# Altium schematic sheet Radar_Power_Sheet.SchDoc
size 420 x 297 mm; SheetNumber: 3; SheetTotal: 6
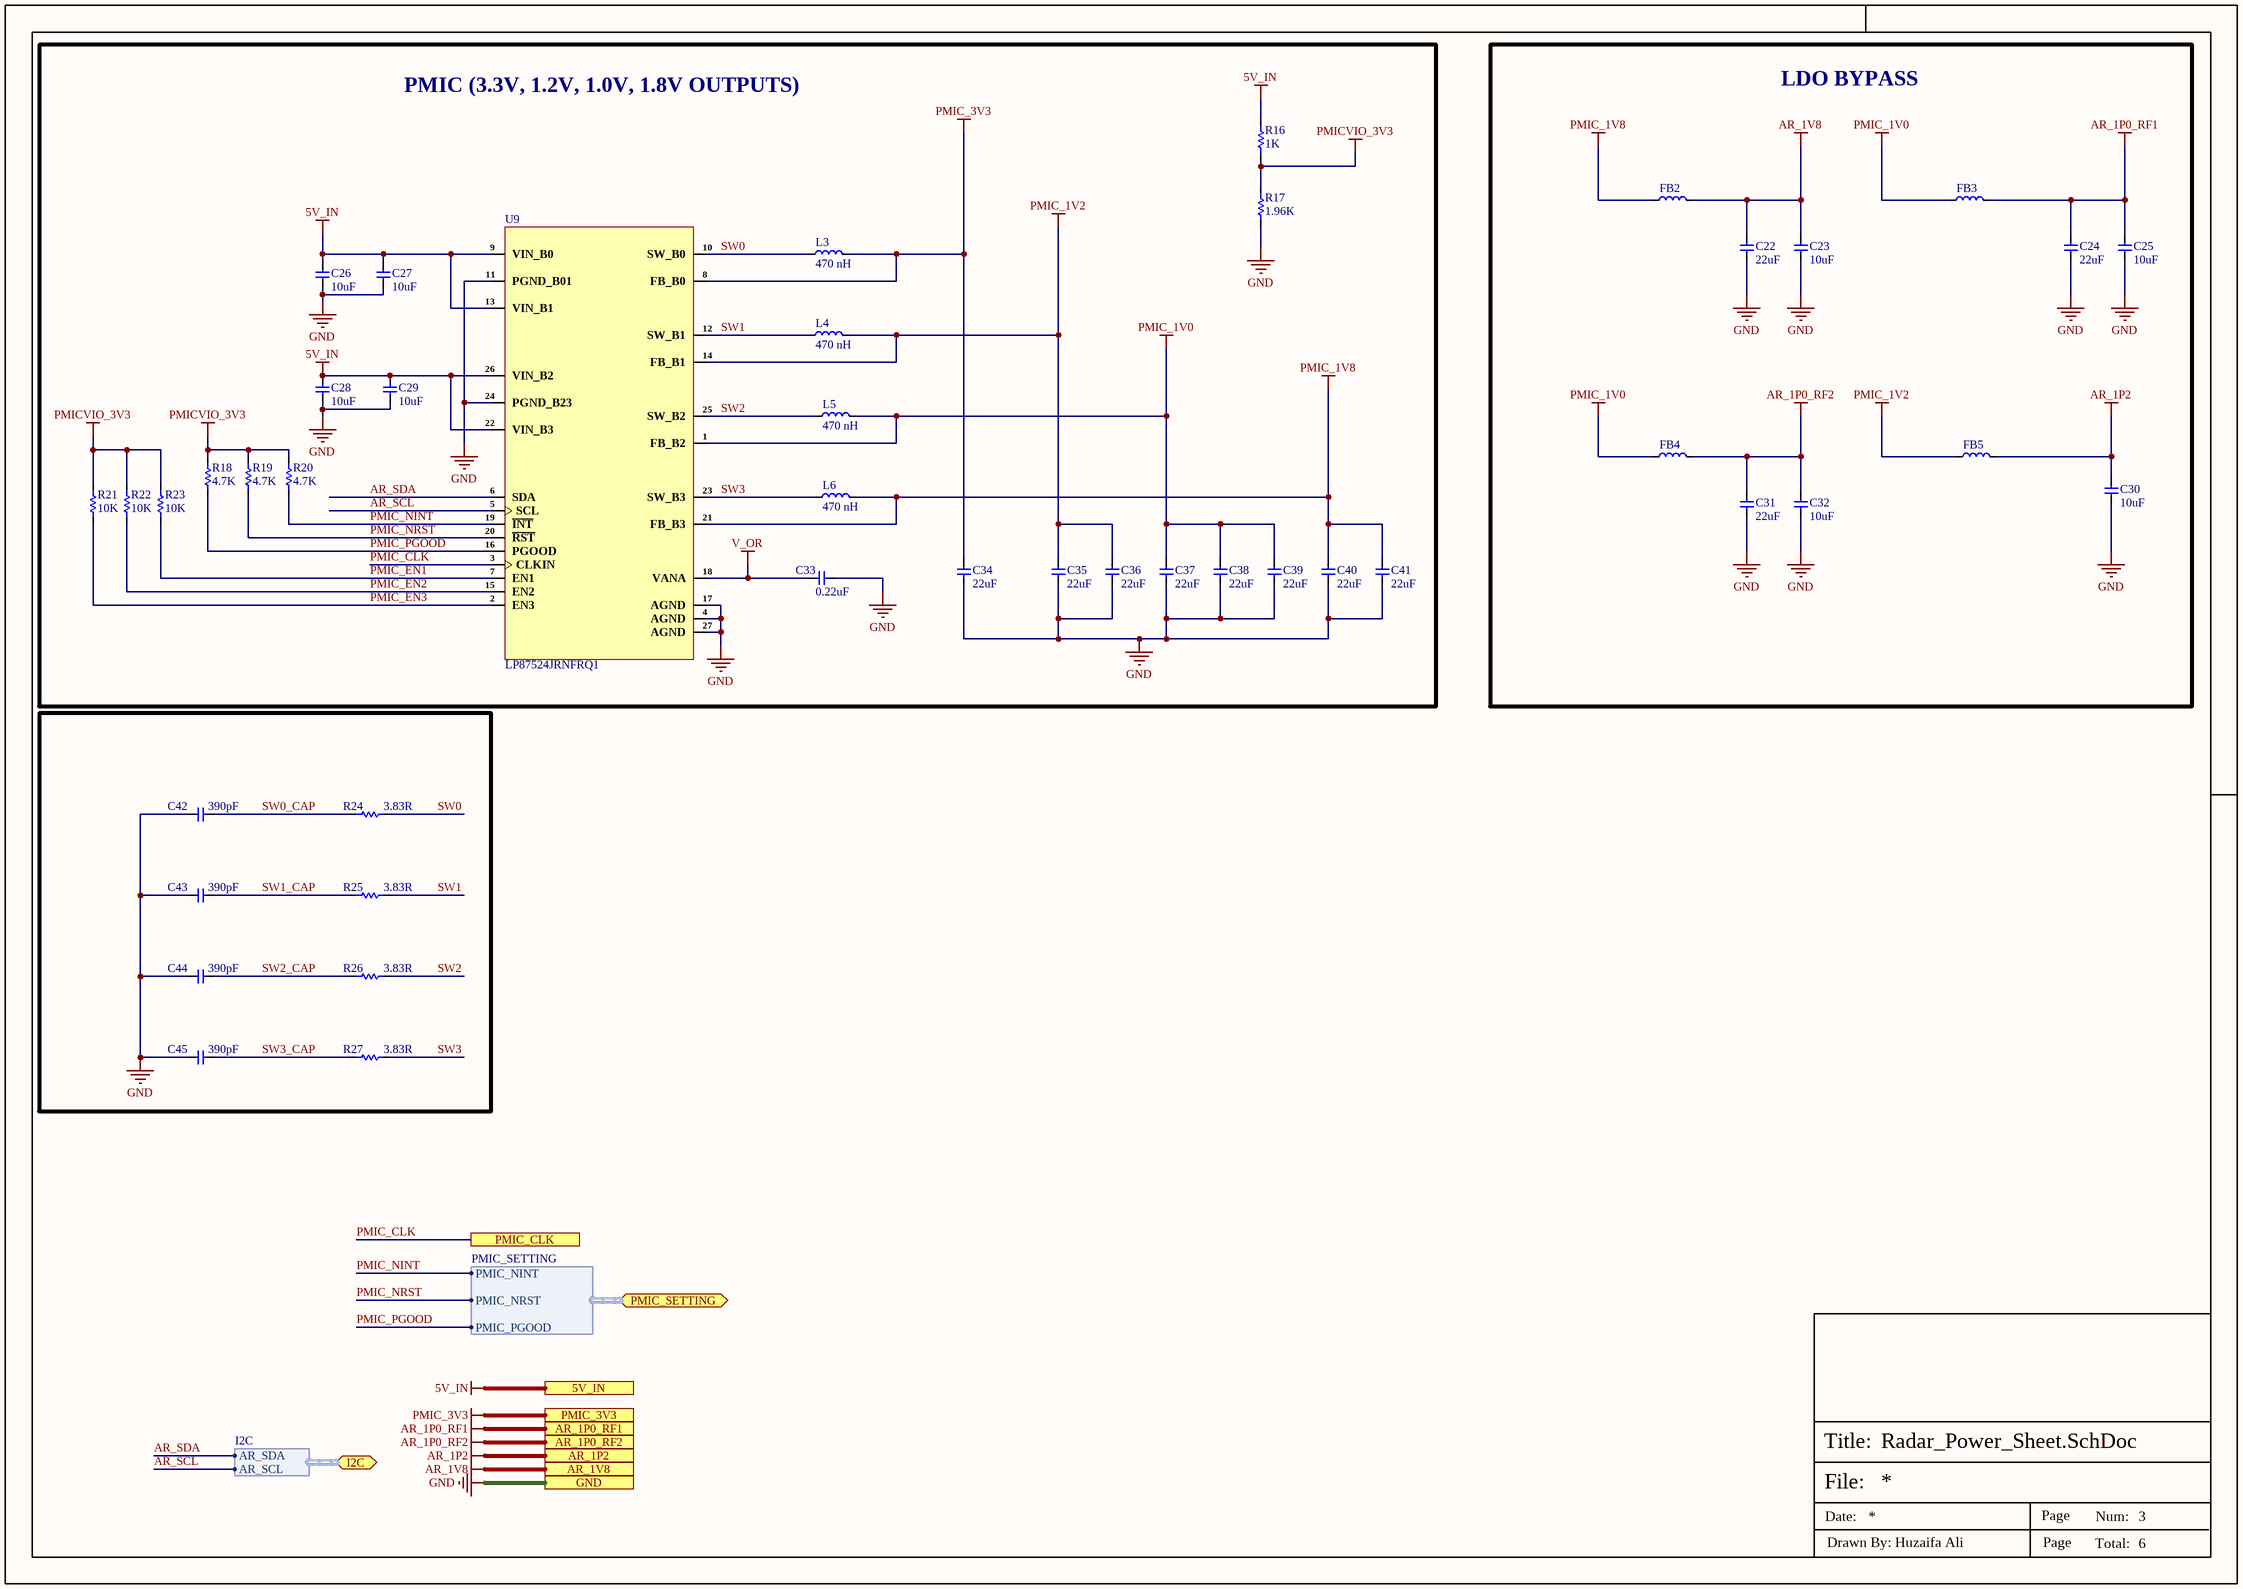
[diagram p0: Radar_Power_Sheet.SchDoc]

## Parts
C22  22uF  [Cap-1206]
C23  10uF  [Cap-0603]
C24  22uF  [Cap-1206]
C25  10uF  [Cap-0603]
C26  10uF  [Cap-0603]
C27  10uF  [Cap-0603]
C28  10uF  [Cap-0603]
C29  10uF  [Cap-0603]
C30  10uF  [Cap-0603]
C31  22uF  [Cap-1206]
C32  10uF  [Cap-0603]
C33  0.22uF  [Cap-0402]
C34  22uF  [Cap-1206]
C35  22uF  [Cap-1206]
C36  22uF  [Cap-1206]
C37  22uF  [Cap-1206]
C38  22uF  [Cap-1206]
C39  22uF  [Cap-1206]
C40  22uF  [Cap-1206]
C41  22uF  [Cap-1206]
C42  390pF  [Cap-0402]
C43  390pF  [Cap-0402]
C44  390pF  [Cap-0402]
C45  390pF  [Cap-0402]
FB2  100MHz  [IND-0603 (1608 Metric)]  (value not drawn)
FB3  100MHz  [IND-0603 (1608 Metric)]  (value not drawn)
FB4  100MHz  [IND-0603 (1608 Metric)]  (value not drawn)
FB5  100MHz  [IND-0603 (1608 Metric)]  (value not drawn)
L3  470 nH  [IND-1008 (2520 Metric)]
L4  470 nH  [IND-1008 (2520 Metric)]
L5  470 nH  [IND-1008 (2520 Metric)]
L6  470 nH  [IND-1008 (2520 Metric)]
R16  1K  [Res-0201]
R17  1.96K  [Res-0603]
R18  4.7K  [Res-0402]
R19  4.7K  [Res-0402]
R20  4.7K  [Res-0402]
R21  10K  [Res-0402]
R22  10K  [Res-0402]
R23  10K  [Res-0402]
R24  3.83R  [Res-0402]
R25  3.83R  [Res-0402]
R26  3.83R  [Res-0402]
R27  3.83R  [Res-0402]
U9  LP87524JRNFRQ1  [26-VQFN-HR (4.5x4)]

## Blocks framed on the sheet
PMIC (3.3V, 1.2V, 1.0V, 1.8V OUTPUTS): C26-C29 C33-C41 L3-L6 R16-R23 U9
LDO BYPASS: C22-C25 C30-C32 FB2-FB5

## Ports
5V_IN, AR_1P0_RF1, AR_1P0_RF2, AR_1P2, AR_1V8, GND, I2C (bidir, harness I2C), PMIC_3V3, PMIC_CLK, PMIC_SETTING (bidir, harness PMIC_SETTING)

## Harnesses
I2C: AR_SDA, AR_SCL
PMIC_SETTING: PMIC_NINT, PMIC_NRST, PMIC_PGOOD

## Nets
5V_IN: C26.2 C27.2 C28.2 C29.2 R16.1 U9.9(VIN_B0) U9.13(VIN_B1) U9.22(VIN_B3) U9.26(VIN_B2) ; port 5V_IN
AR_1P0_RF1: C24.2 C25.2 FB3.2 ; port AR_1P0_RF1
AR_1P0_RF2: C31.2 C32.2 FB4.2 ; port AR_1P0_RF2
AR_1P2: C30.2 FB5.2 ; port AR_1P2
AR_1V8: C22.2 C23.2 FB2.2 ; port AR_1V8
GND: C22.1 C23.1 C24.1 C25.1 C26.1 C27.1 C28.1 C29.1 C30.1 C31.1 C32.1 C33.2 C34.1 C35.1 C36.1 C37.1 C38.1 C39.1 C40.1 C41.1 C42.1 C43.1 C44.1 C45.1 R17.1 U9.4(AGND) U9.11(PGND_B01) U9.17(AGND) U9.24(PGND_B23) U9.27(AGND) ; port GND
PMIC_1V0: C37.2 C38.2 C39.2 FB3.1 FB4.1 L5.2 U9.1(FB_B2)
PMIC_1V2: C35.2 C36.2 FB5.1 L4.2 U9.14(FB_B1)
PMIC_1V8: C40.2 C41.2 FB2.1 L6.2 U9.21(FB_B3)
PMIC_3V3: C34.2 L3.2 U9.8(FB_B0) ; port PMIC_3V3
PMICVIO_3V3: R16.2 R17.2 R18.2 R19.2 R20.2 R21.2 R22.2 R23.2
V_OR: C33.1 U9.18(VANA)
AR_SCL: U9.5(SCL) ; port I2C.AR_SCL
AR_SDA: U9.6(SDA) ; port I2C.AR_SDA
PMIC_CLK: U9.3(CLKIN) ; port PMIC_CLK
PMIC_EN1: R23.1 U9.7(EN1)
PMIC_EN2: R22.1 U9.15(EN2)
PMIC_EN3: R21.1 U9.2(EN3)
PMIC_NINT: R20.1 U9.19(~{INT}) ; port PMIC_SETTING.PMIC_NINT
PMIC_NRST: R19.1 U9.20(~{RST}) ; port PMIC_SETTING.PMIC_NRST
PMIC_PGOOD: R18.1 U9.16(PGOOD) ; port PMIC_SETTING.PMIC_PGOOD
SW0: L3.1 R24.2 U9.10(SW_B0)
SW0_CAP: C42.2 R24.1
SW1: L4.1 R25.2 U9.12(SW_B1)
SW1_CAP: C43.2 R25.1
SW2: L5.1 R26.2 U9.25(SW_B2)
SW2_CAP: C44.2 R26.1
SW3: L6.1 R27.2 U9.23(SW_B3)
SW3_CAP: C45.2 R27.1

## Notes on the sheet
- File:
- Title:
- Date:
- Page
- Num:
- Total:
- Drawn By: Huzaifa Ali

## Library data of the parts
C22 C24 C31 C34-C41 = C3216X5R1E226M160AB: CAP CER 22UF 25V X5R 1206; Manufacturer: TDK; Dielectric Material: Ceramic; Tolerance: 20%; Item Type: Capacitor; Supplier 1: Digi-Key; Manufacturer Part Number: C3216X5R1E226M160AB; Stock 1: 21442; Pricing 1: 1=1.08, 10=0.822, 50=0.6832, 100=0.5882, 500=0.4554, 1000=0.39215 (USD); Mount: Surface Mount; Case/Package: 1206; Case Code (Metric): 3216; Case Code (Imperial): 1206; Weight: 0.000571oz; Min Operating Temperature: -55°C; Max Operating Temperature: 85°C; Voltage Rating: 25V; Capacitance: 22uF; Packaging: Tape and Reel; Voltage Rating (DC): 25V; Dielectric: X5R; Termination: SMD/SMT; Construction: Flat; Package Quantity: 1; Resistor Type: Ceramic; Series: C; Length: 3.2mm; Width: 0.063inch; Height: 1.6mm; Depth: 1.6mm; Thickness: 0.071inch; Lead Free: Lead Free; REACH SVHC: No SVHC; RoHS Compliant: Yes; ComponentLink1URL: https://product.tdk.com/info/en/documents/chara_sheet/C3216X5R1E226M160AB.pdf?src-supplier=Digi-Key; ComponentLink1Description: https://product.tdk.com/info/en/documents/chara_sheet/C3216X5R1E226M160AB.pdf?src-supplier=Digi-Key; ComponentLink2URL: http://www.mouser.com/ds/2/400/lcc_commercial_general_en-837201.pdf?src-supplier=Mouser; ComponentLink2Description: http://www.mouser.com/ds/2/400/lcc_commercial_general_en-837201.pdf?src-supplier=Mouser; Supplier Part Number 1: 445-6000-1-ND; LCSC Part Number: C2167811
C23 C25-C30 C32 = CC0603KRX5R7BB106: CAP CER 10UF 16V X5R 0603; Manufacturer: Yageo; Tolerance: 10%; Item Type: Capacitor; Supplier 1: Digi-Key; Manufacturer Part Number: CC0603KRX5R7BB106; RoHS: Yes; Category: Ceramic Capacitors; Stock 1: 240725; Pricing 1: 1=0.68000, 10=0.48000, 50=0.36300, 100=0.31610, 500=0.23416, 1000=0.19903 (USD); Mount: Surface Mount; Case/Package: 0603; Case Code (Imperial): 0603; Case Code (Metric): 1608; Min Operating Temperature: -55°C; Max Operating Temperature: 85°C; Packaging: Cut Tape; Capacitance: 10uF; Voltage Rating: 16V; RoHS Compliant: Yes; ComponentLink1URL: http://www.yageo.com/documents/recent/UPY-GPHC_X5R_4V-to-50V_25.pdf?src-supplier=Digi-Key; ComponentLink1Description: http://www.yageo.com/documents/recent/UPY-GPHC_X5R_4V-to-50V_25.pdf?src-supplier=Digi-Key; Supplier Part Number 1: 311-3486-1-ND; LCSC Part Number: C2936601
C33 = CC0402KRX5R8BB224: CAP CER 0.22UF 25V X5R 0402; Manufacturer: Yageo; Capacitance: 220nF; Tolerance: 10%; Supplier 1: Mouser; Manufacturer Part Number: CC0402KRX5R8BB224; RoHS: Yes; Category: Ceramic Capacitors; Stock 1: 61266; Pricing 1: 1=0.10000, 10=0.03300, 50=0.03300, 100=0.02700, 1000=0.01500, 10000=0.01300 (USD); Mount: Surface Mount; Case/Package: 0402; Min Operating Temperature: -55°C; Max Operating Temperature: 85°C; Packaging: Tape and Reel; Voltage Rating: 25V; Voltage Rating (DC): 25V; Dielectric: X5R; Length: 0.039inch; Width: 0.02inch; Thickness: 0.022inch; Lead Free: Lead Free; Halogen Free: Halogen Free; RoHS Compliant: Yes; ComponentLink1URL: http://www.yageo.com/documents/recent/UPY-GPHC_X5R_4V-to-50V_25.pdf?src-supplier=Digi-Key; ComponentLink1Description: http://www.yageo.com/documents/recent/UPY-GPHC_X5R_4V-to-50V_25.pdf?src-supplier=Digi-Key; ComponentLink2URL: https://www.yageo.com/upload/media/product/productsearch/datasheet/mlcc/UPY-GPHC_X5R_4V-to-50V_26.pdf?src-supplier=Digi-Key; ComponentLink2Description: https://www.yageo.com/upload/media/product/productsearch/datasheet/mlcc/UPY-GPHC_X5R_4V-to-50V_26.pdf?src-supplier=Digi-Key; ComponentLink3URL: http://www.yageo.com/documents/recent/UPY-GPHC_X5R_4V-to-50V_23.pdf?src-supplier=Digi-Key; ComponentLink3Description: http://www.yageo.com/documents/recent/UPY-GPHC_X5R_4V-to-50V_23.pdf?src-supplier=Digi-Key; Supplier Part Number 1: 603-CC402KRX5R8BB224; LCSC Part Number: C326836
C42-C45 = CGA2B2C0G1H391J050BA: CAP CER 390PF 50V C0G 0402; Manufacturer: TDK; Item Type: apacitors; Supplier: Digikey; Supplier Part Number: 445-5603-1-ND; Manufacturer Part Number: CGA2B2C0G1H391J050BA; RoHS: Yes; Stock: 103846; Pricing: 1=0.1, 10=0.048, 50=0.0278, 100=0.0216, 500=0.01622, 1000=0.01275, 2500=0.01159, 5000=0.01066 (USD); ComponentLink1URL: https://datasheet.ciiva.com/24219/cga2b2c0g1h391j050ba-265720-24219960.pdf?src-supplier=Mouser; ComponentLink1Description: https://datasheet.ciiva.com/24219/cga2b2c0g1h391j050ba-265720-24219960.pdf?src-supplier=Mouser; ComponentLink2URL: https://datasheet.ciiva.com/7975/1807242-7975259.pdf?src-supplier=Element14; ComponentLink2Description: https://datasheet.ciiva.com/7975/1807242-7975259.pdf?src-supplier=Element14
FB2-FB5 = BLM18SP101SZ1D: FERRITE BEAD 100 OHM 0603 1LN; Manufacturer: Murata; Max Current Rating: 3.7A; Number of Lines: 1; Supplier: Rs; Supplier Part Number: 2234942; Manufacturer Part Number: BLM18SP101SZ1D; RoHS: Yes; Category: Ferrite Beads and Chips; Stock: 1800; Pricing: 100=0.065, 500=0.059, 1000=0.048, 2000=0.044 (GBP); Mounting Technology: Surface Mount; Case/Package: 0603; Min Operating Temperature: -55°C; Max Operating Temperature: 125°C; Series: BLM; Ratings: AEC-Q200; LCSC Part Number: C1512136; Item Type: Ferrite Bead
L3-L6 = DFE252012PD-R47M=P2: FIXED IND 470NH 4A 0.027OHM SMD; Manufacturer: Murata; Item Type: Fixed Inductors; Inductance Tolerance: 20%; Saturation Current: 5.2A; ESR: 27mR; Test Frequency: 1MHz; Supplier: Mouser; Supplier Part Number: 81-DFE252012PDR47MP2; Manufacturer Part Number: DFE252012PD-R47M=P2; RoHS: Yes; Stock: 74061; Pricing: 1=0.48, 10=0.342, 50=0.342, 100=0.249, 1000=0.217, 10000=0.201 (USD); Min Operating Temperature: -40°C; Max Operating Temperature: 125°C; Current Rating: 4A; Value: 470nH; RMS Current (Irms): 4A; Tolerance: 20%; Height: 1.2mm; RoHS Compliant: Yes; ComponentLink1URL: http://www.farnell.com/datasheets/2616814.pdf?src-supplier=Farnell; ComponentLink1Description: http://www.farnell.com/datasheets/2616814.pdf?src-supplier=Farnell; ComponentLink2URL: https://search.murata.co.jp/Ceramy/image/img/P02/J(E)TE243A-9102.pdf?src-supplier=Digikey; ComponentLink2Description: https://search.murata.co.jp/Ceramy/image/img/P02/J(E)TE243A-9102.pdf?src-supplier=Digikey; ComponentLink3URL: http://www.farnell.com/datasheets/2616814.pdf?src-supplier=Newark; ComponentLink3Description: http://www.farnell.com/datasheets/2616814.pdf?src-supplier=Newark
R16 = RC0201FR-071KL: RES 1K OHM 1% 1/20W 0201; Manufacturer: Yageo; Value: 1kR; Temperature Coefficient: 200ppm/°C; Power Rating: 50mW; Voltage Rating: 25V; Item Type: Resistor; Supplier: Digi-Key; Supplier Part Number: 311-1KMCT-ND; Manufacturer Part Number: RC0201FR-071KL; RoHS: Yes; Category: Chip SMD Resistors; Stock: 5606340; Pricing: 1=0.1, 10=0.027, 50=0.0172, 100=0.0143, 500=0.00988, 1000=0.00854, 5000=0.00629 (USD); Case/Package: 0201; Contact Plating: Tin,Matte; Case Code (Metric): 0603; Case Code (Imperial): 0201; Min Operating Temperature: -55°C; Max Operating Temperature: 125°C; Tolerance: 1%; Resistor Type: Thick Film; Package Quantity: 10000; Packaging: Tape and Reel; Number of Terminations: 2; Termination: SMD/SMT; Max Power Dissipation: 50mW; Working Voltage: 25V; Features: Moisture Resistant; Series: RC; Resistance Tolerance: 1%; Technology: THICK FILM; Construction: Rectangular; Voltage Rating (DC): 25V; Length: 0.024inch; Width: 0.012inch; Height: 0.01inch; Depth: 0.3mm; Military Standard: Not; RoHS Compliant: Yes; Reach SVHC Compliant: Unknown; Lead Free: 5697LeadFree; ComponentLink1URL: https://datasheet.ciiva.com/7672/1563626-7672204.pdf?src-supplier=Element14; ComponentLink1Description: https://datasheet.ciiva.com/7672/1563626-7672204.pdf?src-supplier=Element14; ComponentLink2URL: https://datasheet.ciiva.com/22698/1563626-22698505.pdf?src-supplier=Element14; ComponentLink2Description: https://datasheet.ciiva.com/22698/1563626-22698505.pdf?src-supplier=Element14; ComponentLink3URL: https://datasheet.ciiva.com/29721/pyu-r-int-thick-7-29721196.pdf?src-supplier=Digi-Key; ComponentLink3Description: https://datasheet.ciiva.com/29721/pyu-r-int-thick-7-29721196.pdf?src-supplier=Digi-Key; ComponentLink4URL: https://datasheet.ciiva.com/29721/pyu-r-int-thick-7-29721195.pdf?src-supplier=Digi-Key; ComponentLink4Description: https://datasheet.ciiva.com/29721/pyu-r-int-thick-7-29721195.pdf?src-supplier=Digi-Key; ComponentLink5URL: https://datasheet.ciiva.com/8896/pyu-rc0201-51-rohs-l-8-8896174.pdf?src-supplier=Avnet; ComponentLink5Description: https://datasheet.ciiva.com/8896/pyu-rc0201-51-rohs-l-8-8896174.pdf?src-supplier=Avnet; LCSC Part Number: C138165
R17 = RC0603FR-071K96L: RES 1.96K OHM 1% 1/10W 0603; Manufacturer: Yageo; Value: 1.96kR; Power Rating: 100mW; Voltage Rating: 75V; Temperature Coefficient: 100ppm/°C; Voltage Rating (DC): 50V; Supplier: Future Electronics; Supplier Part Number: 4765236; Manufacturer Part Number: RC0603FR-071K96L; RoHS: Yes; Category: Chip SMD Resistors; Stock: 30000; Pricing: 5000=0.0015, 50000=0.0014, 150000=0.0014, 375000=0.0013, 1000000=0.0012 (USD); Case/Package: 0603; Case Code (Metric): 1608; Case Code (Imperial): 0603; Weight: 7.1E-05oz; Min Operating Temperature: -55°C; Max Operating Temperature: 155°C; Tolerance: 1%; Packaging: Tape and Reel; Number of Terminations: 2; Termination: SMD/SMT; Max Power Dissipation: 100mW; Features: Moisture Resistant; Series: RC; Construction: Rectangular; Length: 1.6mm; Width: 0.8mm; Height: 0.45mm; Depth: 0.8mm; Military Standard: Not; Lead Free: Lead Free; RoHS Compliant: Yes; ComponentLink1URL: https://datasheet.ciiva.com/2508/pyu-r-int-thick-7-2508485.pdf?src-supplier=Digikey; ComponentLink1Description: https://datasheet.ciiva.com/2508/pyu-r-int-thick-7-2508485.pdf?src-supplier=Digikey; ComponentLink2URL: https://datasheet.ciiva.com/2508/pyu-r-int-thick-7-2508486.pdf?src-supplier=Digikey; ComponentLink2Description: https://datasheet.ciiva.com/2508/pyu-r-int-thick-7-2508486.pdf?src-supplier=Digikey; ComponentLink3URL: https://datasheet.ciiva.com/2508/pyu-r-int-thick-7-2508487.pdf?src-supplier=Digikey; ComponentLink3Description: https://datasheet.ciiva.com/2508/pyu-r-int-thick-7-2508487.pdf?src-supplier=Digikey; ComponentLink4URL: https://datasheet.ciiva.com/15189/getdatasheetpartid-327907-15189642.pdf?src-supplier=Verical; ComponentLink4Description: https://datasheet.ciiva.com/15189/getdatasheetpartid-327907-15189642.pdf?src-supplier=Verical
R18-R20 = RC0402FR-074K7L: RES 4.7K OHM 1% 1/16W 0402; Manufacturer: Yageo; Voltage Rating (DC): 50V; Power Rating: 62.5mW; Resistance: 4.7kR; Temperature Coefficient: 100ppm/°C; Max Power Dissipation: 63mW; Item Type: Resistor; Supplier 1: Avnet; Manufacturer Part Number: RC0402FR-074K7L; RoHS: Yes; Category: Chip SMD Resistors; Stock 1: 2420000; Pricing 1: 10000=0.00085 (USD); Case/Package: 0402; Number of Pins: 2; Case Code (Imperial): 0402; Case Code (Metric): 1005; Size Code: 0402; Min Operating Temperature: -55°C; Max Operating Temperature: 155°C; Tolerance: 1%; Voltage Rating: 50V; Packaging: Tape and Reel; Resistor Type: Thick Film; Termination: SMD/SMT; Features: Moisture Resistant; Series: RC; Number of Terminations: 2; Resistance Tolerance: 1%; Construction: Rectangular; Length: 1mm; Width: 0.5mm; Height: 0.32mm; Depth: 0.5mm; Height - Seated (Max): 0.016inch; RoHS Compliant: Yes; Reach SVHC Compliant: Yes; Military Standard: Not; Lead Free: Lead Free; ComponentLink1URL: https://datasheet.ciiva.com/22661/1686128-22661342.pdf?src-supplier=Element14; ComponentLink1Description: https://datasheet.ciiva.com/22661/1686128-22661342.pdf?src-supplier=Element14; ComponentLink2URL: https://datasheet.ciiva.com/7850/1018594-7850022.pdf?src-supplier=Element14; ComponentLink2Description: https://datasheet.ciiva.com/7850/1018594-7850022.pdf?src-supplier=Element14; ComponentLink3URL: https://datasheet.ciiva.com/7850/1018594-7850023.pdf?src-supplier=Element14; ComponentLink3Description: https://datasheet.ciiva.com/7850/1018594-7850023.pdf?src-supplier=Element14; ComponentLink4URL: https://datasheet.ciiva.com/15215/getdatasheetpartid-328119-15215035.pdf?src-supplier=Verical; ComponentLink4Description: https://datasheet.ciiva.com/15215/getdatasheetpartid-328119-15215035.pdf?src-supplier=Verical; Supplier Part Number 1: RC0402FR-074K7L; LCSC Part Number: C105871
R21-R23 = RC0402FR-0710KL: RES 10K OHM 1% 1/16W 0402; Manufacturer: Yageo; Resistance: 10kR; Voltage Rating (DC): 50V; Temperature Coefficient: 100ppm/°C; Power Rating: 62.5mW; Max Power Dissipation: 63mW; Item Type: Resistor; Supplier 1: Mouser; Manufacturer Part Number: RC0402FR-0710KL; RoHS: Yes; Category: Chip SMD Resistors; Stock 1: 18648329; Pricing 1: 1=0.10000, 10=0.01400, 50=0.01400, 100=0.00500, 1000=0.00300, 10000=0.00200 (USD); Case/Package: 0402; Number of Pins: 2; Case Code (Imperial): 0402; Case Code (Metric): 1005; Min Operating Temperature: -55°C; Max Operating Temperature: 155°C; Resistor Type: Thick Film; Tolerance: 1%; Packaging: Tape and Reel; Voltage Rating: 50V; Termination: SMD/SMT; Working Voltage: 50V; Number of Terminations: 2; Features: Moisture Resistant; Series: RC; Resistance Tolerance: 1%; Construction: Rectangular; Length: 1mm; Width: 0.5mm; Height: 0.32mm; Depth: 0.5mm; Lead Pitch: 0.2mm; REACH SVHC: No SVHC; Lead Free: Lead Free; RoHS Compliant: Yes; Military Standard: Not; ComponentLink1URL: https://datasheet.ciiva.com/7660/38568-7660787.pdf?src-supplier=Element14; ComponentLink1Description: https://datasheet.ciiva.com/7660/38568-7660787.pdf?src-supplier=Element14; ComponentLink2URL: https://datasheet.ciiva.com/7849/1686128-7849814.pdf?src-supplier=Element14; ComponentLink2Description: https://datasheet.ciiva.com/7849/1686128-7849814.pdf?src-supplier=Element14; ComponentLink3URL: https://datasheet.ciiva.com/7983/1018594-7983486.pdf?src-supplier=Element14; ComponentLink3Description: https://datasheet.ciiva.com/7983/1018594-7983486.pdf?src-supplier=Element14; ComponentLink4URL: https://datasheet.ciiva.com/22747/1018594-22747512.pdf?src-supplier=Element14; ComponentLink4Description: https://datasheet.ciiva.com/22747/1018594-22747512.pdf?src-supplier=Element14; ComponentLink5URL: https://datasheet.ciiva.com/12667/pyu-rc0402-51-rohs-l-6-r-12667067.pdf?src-supplier=Mouser; ComponentLink5Description: https://datasheet.ciiva.com/12667/pyu-rc0402-51-rohs-l-6-r-12667067.pdf?src-supplier=Mouser; ComponentLink6URL: https://datasheet.ciiva.com/7849/1784430-7849813.pdf?src-supplier=Element14; ComponentLink6Description: https://datasheet.ciiva.com/7849/1784430-7849813.pdf?src-supplier=Element14; ComponentLink7URL: https://datasheet.ciiva.com/7849/1784430-7849815.pdf?src-supplier=Element14; ComponentLink7Description: https://datasheet.ciiva.com/7849/1784430-7849815.pdf?src-supplier=Element14; Supplier Part Number 1: 603-RC0402FR-0710KL; LCSC Part Number: C60490
R24-R27 = CRCW04023R83FKED: RES SMD 3.83 OHM 1% 1/16W 0402; Manufacturer: Vishay Dale; Item Type: Resistors; Voltage Rating (DC): 50V; Supplier: Mouser; Supplier Part Number: 71-CRCW04023R83FKED; Manufacturer Part Number: CRCW04023R83FKED; RoHS: Yes; Stock: 23660; Pricing: 1=0.1, 10=0.023, 50=0.023, 100=0.013, 1000=0.01, 10000=0.005 (USD); ComponentLink1URL: https://datasheet.ciiva.com/2464/dcrcwe3-2464766.pdf?src-supplier=Digikey; ComponentLink1Description: https://datasheet.ciiva.com/2464/dcrcwe3-2464766.pdf?src-supplier=Digikey; ComponentLink2URL: https://datasheet.ciiva.com/2464/dcrcwe3-2464767.pdf?src-supplier=Digikey; ComponentLink2Description: https://datasheet.ciiva.com/2464/dcrcwe3-2464767.pdf?src-supplier=Digikey; ComponentLink3URL: https://datasheet.ciiva.com/2464/dcrcwe3-2464765.pdf?src-supplier=Digikey; ComponentLink3Description: https://datasheet.ciiva.com/2464/dcrcwe3-2464765.pdf?src-supplier=Digikey; ComponentLink4URL: https://datasheet.ciiva.com/9076/dcrcwe3-9076442.pdf?src-supplier=Avnet; ComponentLink4Description: https://datasheet.ciiva.com/9076/dcrcwe3-9076442.pdf?src-supplier=Avnet
U9 = LP87524JRNFRQ1: IC REG BUCK ADJ QUAD 26VQFN; Manufacturer: Texas Instruments; Supplier: Mouser; Supplier Part Number: 595-LP87524JRNFRQ1; Manufacturer Part Number: LP87524JRNFRQ1; RoHS: Yes; Item Type: IC; Stock: 3780; Pricing: 1=5.94, 10=5.2, 50=5.2, 100=4.37, 1000=3.14, 10000=2.91 (USD); Pins: 26NUMBER; Thickness: 900um; ComponentLink1URL: http://www.ti.com/general/docs/suppproductinfo.tsp?distId=10&amp;gotoUrl=http%3A%2F%2Fwww.ti.com%2Flit%2Fgpn%2Flp87524j-q1&src-supplier=Digikey; ComponentLink1Description: http://www.ti.com/general/docs/suppproductinfo.tsp?distId=10&amp;gotoUrl=http%3A%2F%2Fwww.ti.com%2Flit%2Fgpn%2Flp87524j-q1&src-supplier=Digikey